# EAGLE design ESP32S3 LoRa Mini Camera Board 120426 (EAGLE 6.5.0)
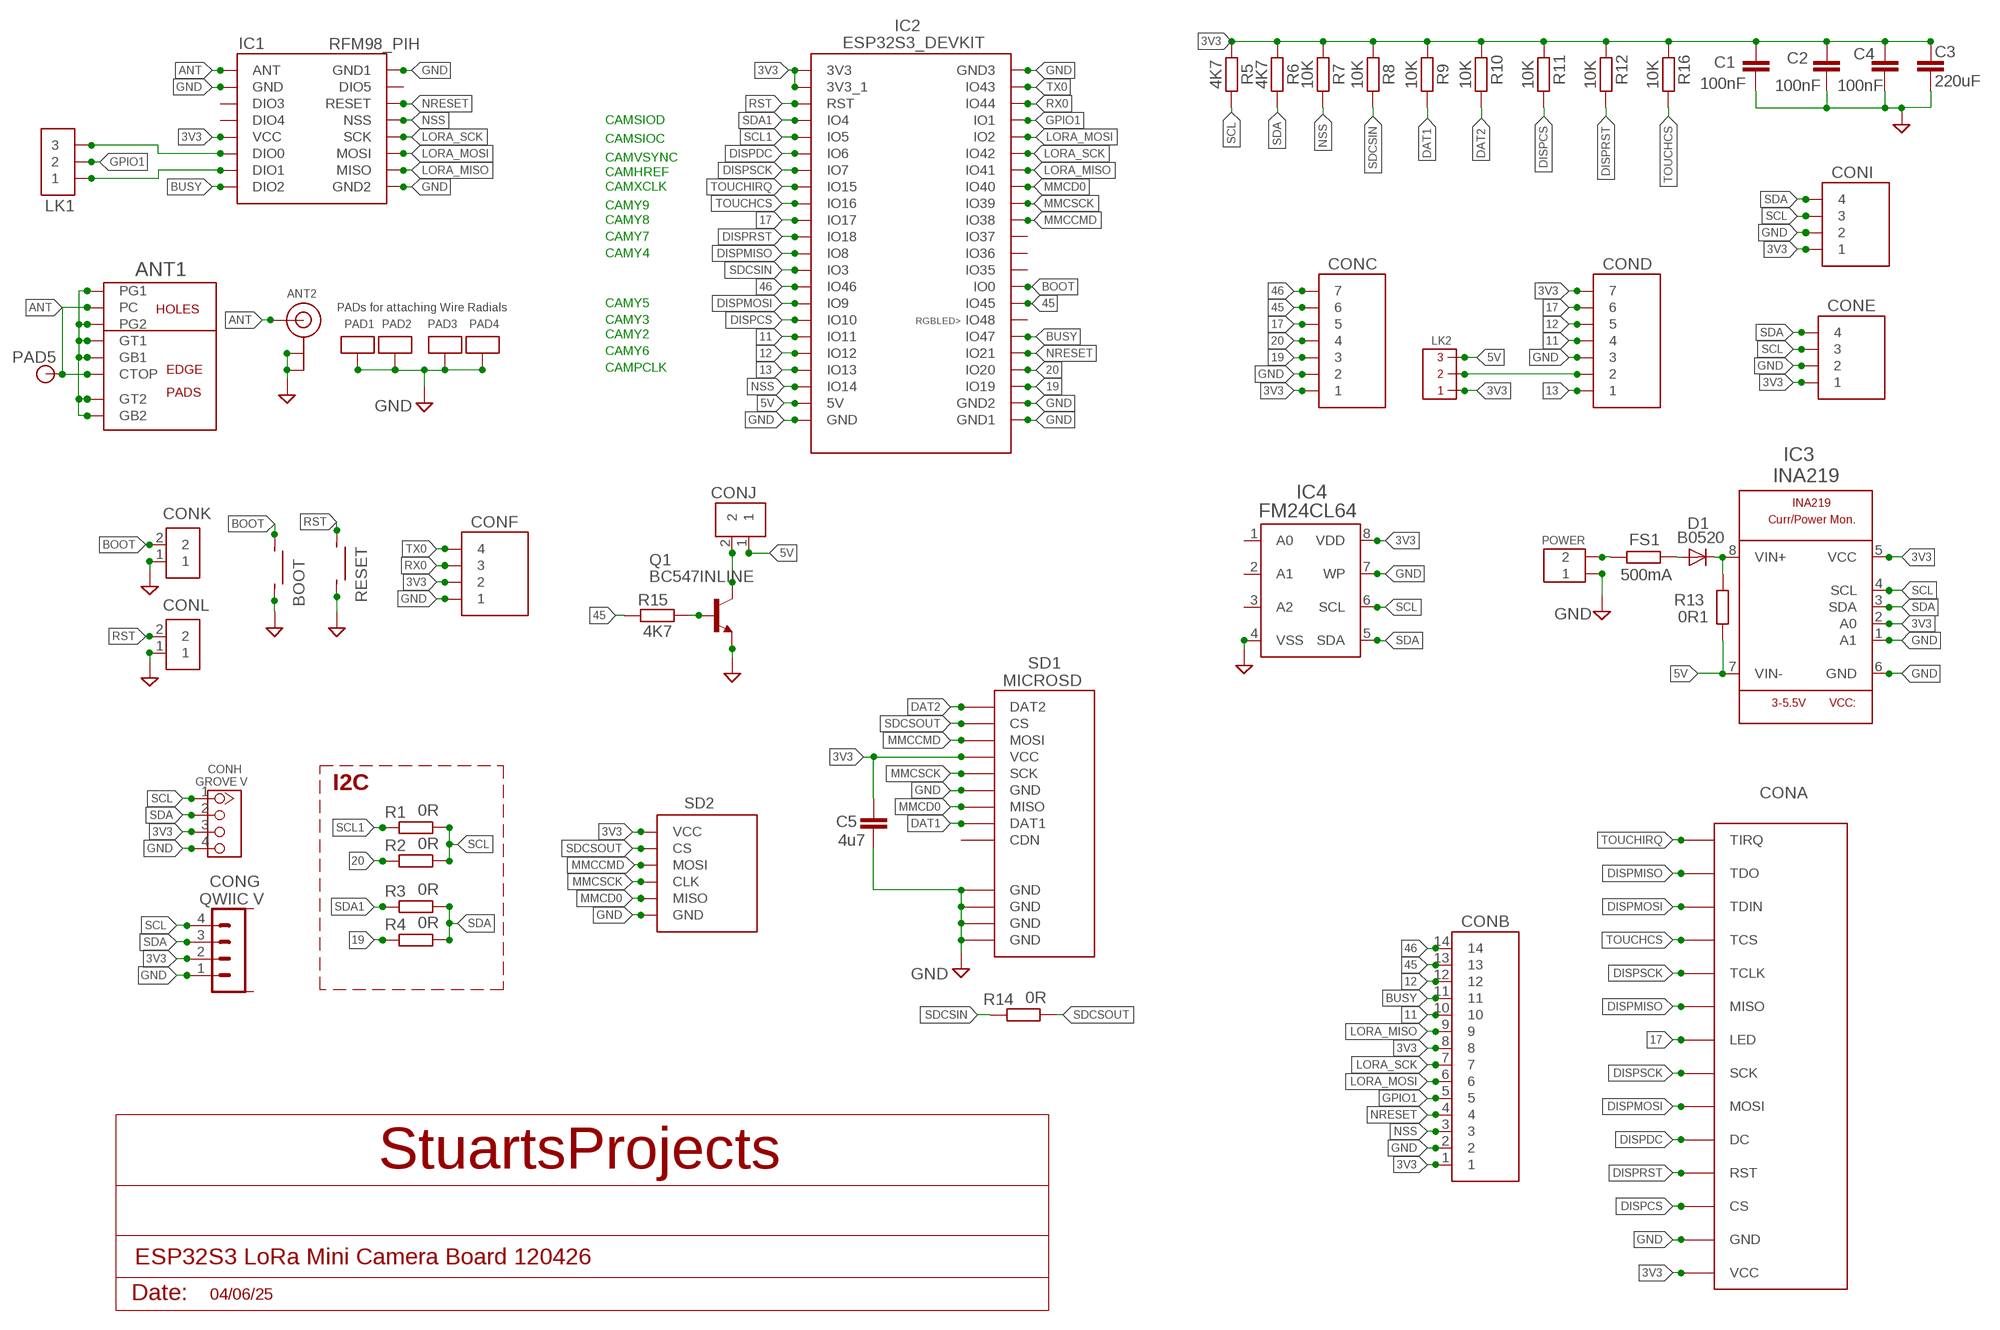
[diagram p0: schematic, sheet 1]

## Parts
ANT1  CUSTOMSMA  [CUSTOMSMA]
ANT2  ANTENNA_U.FL  [U.FL]
BOOT  SMALLSMTSWITCH  [SMALLSMTSWITCH]
C1  100nF  C-EUC1206  [C1206]
C2  100nF  C-EUC1206  [C1206]
C3  220uF  C-EUC1210K  [C1210K]
C4  100nF  C-EUC1206  [C1206]
C5  4u7  C-EUC1206  [C1206]
CONA  ILI9341  ILI9341_2_4_INCH_NOSD_DEFAULT  [ILI9341_2_4_INCH_NOSD]
CONB  14X1  [14X1]
CONC  7X1STD  [7X1]
COND  7X1STD  [7X1]
CONE  4X1  [4X1]
CONF  4X1  [4X1]
CONG  QWIIC V  BM04B-SRSS-TB  [BM04B-SRSS-TB]
CONH  GROVE V  GROVE-CONNECTOR-DIP(4P-2.0)  [HW4-2.0]
CONI  4X1  [4X1]
CONJ  2X1  [2X1]
CONK  2X1  [2X1]
CONL  2X1  [2X1]
D1  B0520  DIODE-SOD123  [SOD123]
FS1  500mA  R-EU_M1206  [M1206]
IC1  RFM98_PIH  [RFM98_PIH]
IC2  ESP32S3_DEVKIT  ESP32S3_DEVKIT_DEFAULT  [ESP32S3_DEVKIT]
IC3  INA219  INA219_SOIC8  [SOIC8]
IC4  FM24CL64  24L256SOIC2  [SOIC_2]
LK1  3X1  [3X1]
LK2  3PINMICROHEADER_ROUND2  [3PINMICROHEADER_SMALL_ROUND_2]
PAD1  ANTPAD2  [ANTPAD2]
PAD2  ANTPAD2  [ANTPAD2]
PAD3  ANTPAD2  [ANTPAD2]
PAD4  ANTPAD2  [ANTPAD2]
PAD5  PAD_ROUND_0_6MM_HOLE  [PAD-ROUND_0_6MM_HOLE]
POWER  SCREWTERMINAL_2WAY_0_1_INCH  [SCREWTERMINAL_2WAY_0_1_INCH]
Q1  BC547INLINE  [TO92-CBE]
R1  0R  R-EU_M1206  [M1206]
R2  0R  R-EU_M1206  [M1206]
R3  0R  R-EU_M1206  [M1206]
R4  0R  R-EU_M1206  [M1206]
R5  4K7  R-EU_M1206  [M1206]
R6  4K7  R-EU_M1206  [M1206]
R7  10K  R-EU_M1206  [M1206]
R8  10K  R-EU_M1206  [M1206]
R9  10K  R-EU_M1206  [M1206]
R10  10K  R-EU_M1206  [M1206]
R11  10K  R-EU_M1206  [M1206]
R12  10K  R-EU_M1206  [M1206]
R13  0R1  R-EU_R1206  [R1206]
R14  0R  R-EU_M1206  [M1206]
R15  4K7  R-EU_M1206  [M1206]
R16  10K  R-EU_M1206  [M1206]
RESET  SMALLSMTSWITCH  [SMALLSMTSWITCH]
SD1  MICROSD  MICROSD_PP  [MICROSD_PP]
SD2  MICROSD_BREAKOUT2_DEFAULT  [MICROSD_BREAKOUT2]

## Nets
3V3 [POWER]: C1.2 C2.2 C3.1 C4.2 C5.1 CONA.VCC CONB.1 CONB.8 CONC.1 COND.7 CONE.1 CONF.2 CONG.2 CONH.3 CONI.1 IC1.VCC IC2.3V3 IC2.3V3_1 IC3.2(A0) IC3.5(VCC) IC4.8(VDD) LK2.1 R5.2 R6.2 R7.2 R8.2 R9.2 R10.2 R11.2 R12.2 R16.2 SD1.VCC SD2.VCC
5V [POWER]: CONJ.1 IC2.5V IC3.7(VIN-) LK2.3 R13.1
11: CONB.10 COND.4 IC2.11(IO11)
12: CONB.12 COND.5 IC2.12(IO12)
13: COND.1 IC2.13(IO13)
17: CONA.LED CONC.5 COND.6 IC2.17(IO17)
19: CONC.3 IC2.19(IO19) R4.2
20: CONC.4 IC2.20(IO20) R2.2
45: CONB.13 CONC.6 IC2.45(IO45) R15.2
46: CONB.14 CONC.7 IC2.46(IO46)
ANT [Antenna]: ANT1.CTOP ANT1.PC ANT2.3(SIGNAL) IC1.ANT PAD5.P$1
BOOT: BOOT.P$4 CONK.2 IC2.0(IO0)
BUSY: CONB.11 IC1.DIO2 IC2.47(IO47)
DAT1: R9.1 SD1.DAT1
DAT2: R10.1 SD1.DAT2
DISPCS: CONA.CS IC2.10(IO10) R11.1
DISPDC: CONA.DC IC2.6(IO6)
DISPMISO: CONA.MISO CONA.TDO IC2.8(IO8)
DISPMOSI: CONA.MOSI CONA.TDIN IC2.9(IO9)
DISPRST: CONA.RST IC2.18(IO18) R12.1
DISPSCK: CONA.SCK CONA.TCLK IC2.7(IO7)
GND [POWER]: ANT1.G1 ANT1.G2 ANT1.GB1 ANT1.GB2 ANT1.GT1 ANT1.GT2 ANT2.1(GND) ANT2.2(GND) BOOT.P$3 C1.1 C2.1 C3.2 C4.1 C5.2 CONA.GND CONB.2 CONC.2 COND.3 CONE.2 CONF.1 CONG.1 CONH.4 CONI.2 CONK.1 CONL.1 IC1.GND IC1.GND1 IC1.GND2 IC2.GND IC2.GND1 IC2.GND2 IC2.GND3 IC3.1(A1) IC3.6(GND) IC4.4(VSS) IC4.7(WP) PAD1.P$1 PAD2.P$1 PAD3.P$1 PAD4.P$1 POWER.P$1 Q1.E RESET.P$3 SD1.GND SD1.GND@1(GND) SD1.GND@2(GND) SD1.GND@3(GND) SD1.GND@4(GND) SD2.GND
GPIO1: CONB.5 IC2.1(IO1) LK1.2
LORA_MISO: CONB.9 IC1.MISO IC2.41(IO41)
LORA_MOSI: CONB.6 IC1.MOSI IC2.2(IO2)
LORA_SCK: CONB.7 IC1.SCK IC2.42(IO42)
MMCCMD: IC2.38(IO38) SD1.MOSI SD2.MOSI
MMCD0: IC2.40(IO40) SD1.MISO SD2.MISO
MMCSCK: IC2.39(IO39) SD1.SCK SD2.SCK(CLK)
N$1 [POWER]: D1.C IC3.8(VIN+) R13.2
N$2: IC1.DIO0 LK1.3
N$3 [POWER]: FS1.1 POWER.P$2
N$4: IC1.DIO1 LK1.1
N$6 [POWER]: D1.A FS1.2
N$7: Q1.B R15.1
N$8 [POWER]: CONJ.2 Q1.C
N$10: COND.2 LK2.2
NRESET: CONB.4 IC1.RESET IC2.21(IO21)
NSS: CONB.3 IC1.NSS IC2.14(IO14) R7.1
RST: CONL.2 IC2.RST RESET.P$4
RX0: CONF.3 IC2.44(IO44)
SCL: CONE.3 CONG.4 CONH.1 CONI.3 IC3.4(SCL) IC4.6(SCL) R1.1 R2.1 R5.1
SCL1: IC2.5(IO5) R1.2
SDA: CONE.4 CONG.3 CONH.2 CONI.4 IC3.3(SDA) IC4.5(SDA) R3.1 R4.1 R6.1
SDA1: IC2.4(IO4) R3.2
SDCSIN: IC2.3(IO3) R8.1 R14.2
SDCSOUT: R14.1 SD1.CS SD2.CS
TOUCHCS: CONA.TCS IC2.16(IO16) R16.1
TOUCHIRQ: CONA.TIRQ IC2.15(IO15)
TX0: CONF.4 IC2.43(IO43)
Unconnected: CONG.M1 CONG.M2 IC1.DIO3 IC1.DIO4 IC1.DIO5 IC2.35(IO35) IC2.36(IO36) IC2.37(IO37) IC2.48(IO48) IC4.1(A0) IC4.2(A1) IC4.3(A2) SD1.CDN

## Notes on the sheet
- CAMSIOD
- CAMSIOC
- CAMVSYNC
- CAMHREF
- CAMXCLK
- CAMY9
- CAMY8
- CAMY7
- CAMY4
- CAMY5
- PADs for attaching Wire Radials
- CAMY3
- CAMY2
- CAMY6
- CAMPCLK
- I2C
- 04/06/25

## Library data of the parts
ANT1 = con-coax:CUSTOMSMA
ANT2 = adafruit:ANTENNA_U.FL: U.FL Antenna Connector
BOOT RESET = LMA2:SMALLSMTSWITCH
C1-C5 = resistor:C-EU: CAPACITOR, European symbol
CONA = LMA2:ILI9341_2_4_INCH_NOSD
CONB = My_Pin_Headers:14X1
CONC COND = My_Pin_Headers:7X1
CONE CONF CONI = My_Pin_Headers:4X1
CONG = con-JST2:BM04B-SRSS: JST SH series header 1.00mm pitch disconnectable crimp style connectors, vertical (side entry type), 4 pins
CONH = OPL_Connector:GROVE-CONNECTOR-DIP(4P-2.0): 320110033; VALUE: 4P-2.0
CONJ CONK CONL = My_Pin_Headers:2X1
D1 = diode:DIODE-: DIODE
FS1 R1-R16 = resistor:R-EU_: RESISTOR, European symbol
IC1 = LMA2:RFM98_PIH
IC2 = LMA2:ESP32S3_DEVKIT
IC3 = INA219:INA219: INA219 - I2C Current/Power Monitor Voltage Range: 0-26V Accuracy: 0.5% Temperature: -40°C - 125°C Check availability <https://pricing.snapeda.com/parts/INA219/Texas%20Instruments/view-part?ref=eda>
IC4 = LMA2:24L256
LK1 = My_Pin_Headers:3X1
LK2 = LMA2:3PINMICROHEADER
PAD1-PAD4 = LMA2:ANTPAD2
PAD5 = pads:PAD_ROUND
POWER = LMA2:SCREWTERMINAL_2WAY_0_1_INCH
Q1 = transistor-npn:BC547*: NPN Transistor
SD1 = DE1594-v2:MICROSD_PP
SD2 = LMA2:MICROSD_BREAKOUT2

## Net classes
0 default: width 0.203 mm, drill 0.406 mm
1 POWER: width 0.635 mm, drill 0.61 mm
2 VDD: width 0.635 mm
3 Antenna: width 0.305 mm

## Board
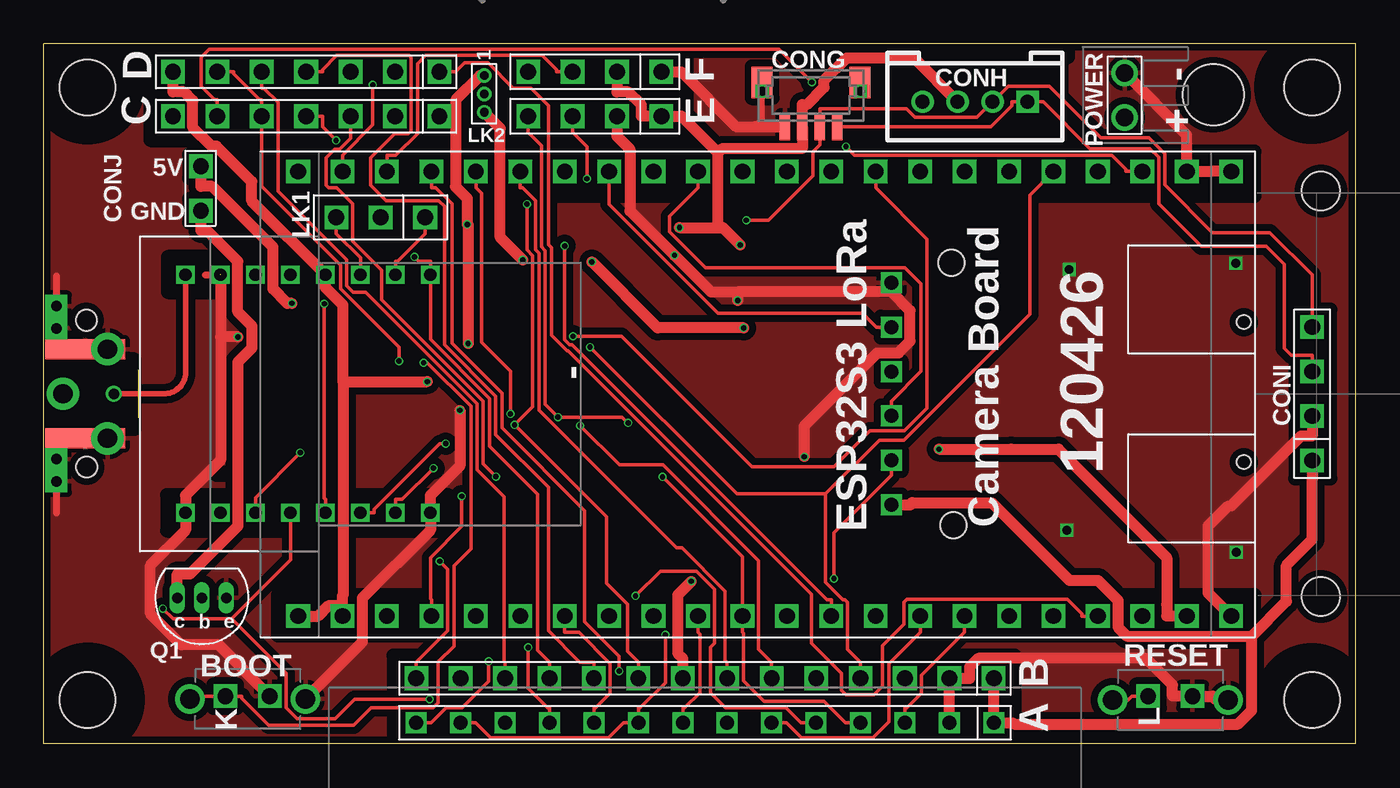
[diagram p1: board, top side]
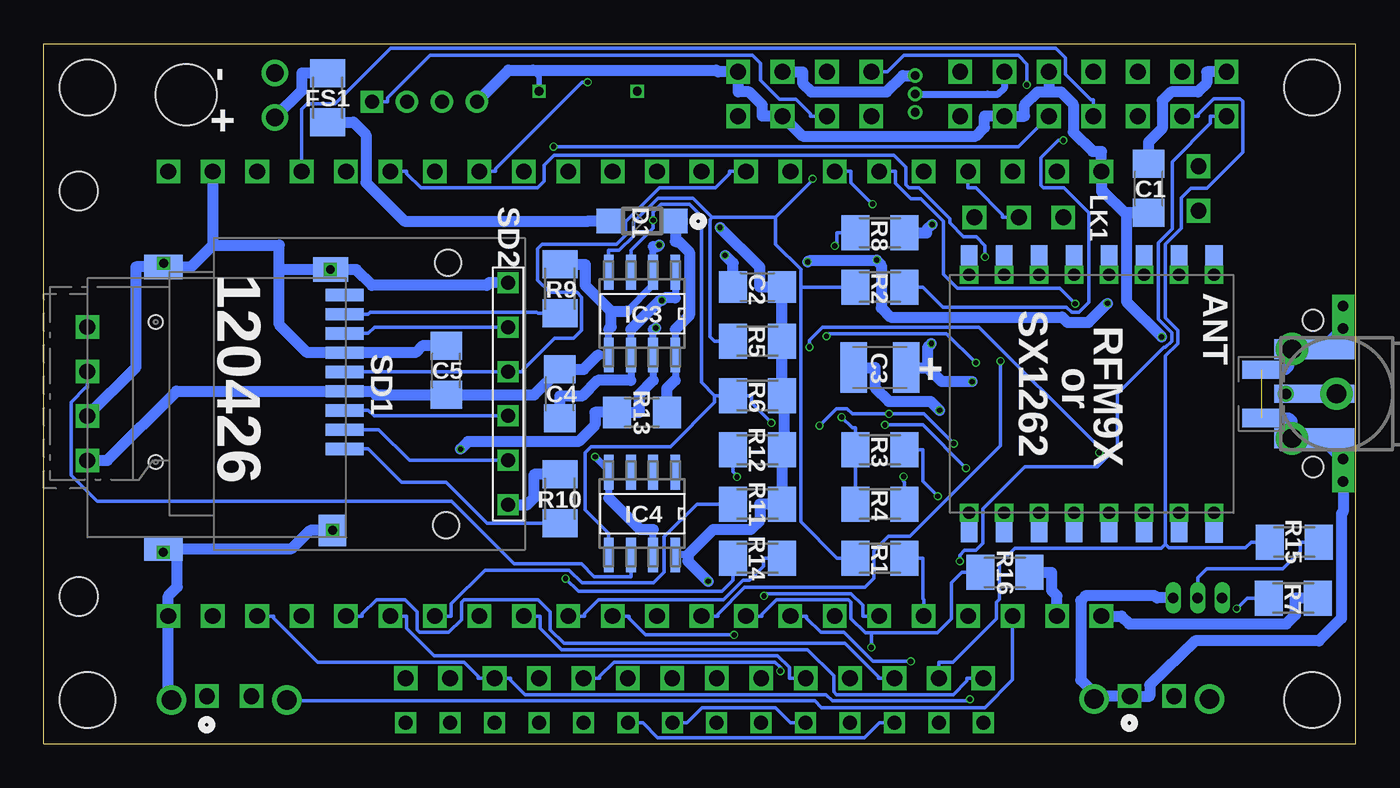
[diagram p2: board, bottom side, seen from below]

Size 75 x 40 mm. Coordinates in mm from the lower left corner, seen from the top.
Outline: 0,0 0,40 75,40 75,0 0,0
Copper layers (1*16): Top 0.035559375mm / dielectric 1.6mm / Bottom 0.035559375mm
Design rules "jlcpcb2layer_Stuarts": minimum track width 5mil, minimum drill 12mil, track to track 6mil, track to pad 6mil, pad to pad 6mil, via to via 6mil, smd to smd 6mil, copper to edge 8mil, drill to drill 6mil, minimum pad ring 5mil, minimum via ring 3mil, stop-mask expansion 2.5mil, vias tented up to drill 1000mil, thermal gap 10mil
Holes 3.2 mm at 2.5,2.5 72.5,2.5 2.5,37.5 72.5,37.5
Holes 1.2 mm at 2.45,15.81 2.44,24.2
Holes 3.5 mm at 66.86,37.08
Holes 2.2 mm at 73,31.58 73,8.42
tRestrict: area 69.8,-0.2 to 75.2,5.2; area -0.2,34.9 to 5.2,40.2; area 69.8,34.9 to 75.1,40.2; area -0.2,-0.1 to 5.2,5.2; area 5.5,37.7 to 6.6,38.2; area 9.9,15.4 to 10.4,15.5; area 12.8,2 to 13,2.1; area 6.1,34.5 to 36.8,39.8; area 20,-0.1 to 55.5,5; area 13.4,6.2 to 69.2,8.5; area 13.4,31.3 to 69.2,33.8; area 71.5,15.2 to 73.5,24.8; 5 more areas
bRestrict: area -0.2,34.9 to 5.1,40.2; area 69.8,34.7 to 75.1,40; area 69.9,-0.1 to 75.2,5.2; area -0.2,-0.1 to 5.1,5.2; area 0,13.9 to 9.5,26.1

### Footprints (pad centres in the part's own frame; a part is rotated, then mirrored left to right if it is on the bottom)
CUSTOMSMA = smd 4.572 x 1.016: CTOP -1.27,0 | drill 1.1 pad 1.85: G1 -2.55,2.55; G2 -2.55,-2.55; PC 0,0 | smd 4.572 x 1.143 bottom: GB1 -1.27,2.54; GB2 -1.27,-2.54 | smd 4.572 x 1.143: GT1 -1.27,2.54; GT2 -1.27,-2.54
U.FL = smd 2.2 x 1.05: 1 0,1.375; 2 0,-1.375 | smd 0.8 x 1: 3 1.525,0
SMALLSMTSWITCH = drill 1.1 pad 1.7: P$3 -3.3,0; P$4 3.3,0
C1206 = smd 1.6 x 1.8: 1 -1.4,0; 2 1.4,0
C1210K = smd 1.5 x 2.9: 1 -1.5,0; 2 1.5,0
ILI9341_2_4_INCH_NOSD = drill 0.8 square: CS -11.43,0; DC -6.35,0; GND -13.97,0; LED 1.27,0; MISO 3.81,0; MOSI -3.81,0; RST -8.89,0; SCK -1.27,0; TCLK 6.35,0; TCS 8.89,0; TDIN 11.43,0; TDO 13.97,0; TIRQ 16.51,0; VCC -16.51,0
14X1 = drill 0.9 square: 1 -16.51,0; 2 -13.97,0; 3 -11.43,0; 4 -8.89,0; 5 -6.35,0; 6 -3.81,0; 7 -1.27,0; 8 1.27,0; 9 3.81,0; 10 6.35,0; 11 8.89,0; 12 11.43,0; 13 13.97,0; 14 16.51,0
7X1 = drill 0.9 square: 1 -7.62,0; 2 -5.08,0; 3 -2.54,0; 4 0,0; 5 2.54,0; 6 5.08,0; 7 7.62,0
4X1 = drill 0.9 square: 1 -3.81,0; 2 -1.27,0; 3 1.27,0; 4 3.81,0
BM04B-SRSS-TB = smd 0.6 x 1.55: 1 1.5,0; 2 0.5,0; 3 -0.5,0; 4 -1.5,0 | smd 1.2 x 1.8: M1 2.8,-2.525; M2 -2.8,-2.525
HW4-2.0 = drill 0.8 pad 1.27 square: 1 -3,0 | drill 0.8 pad 1.27: 2 -1,0; 3 1,0; 4 3,0
2X1 = drill 0.9 square: 1 -1.27,0; 2 1.27,0
SOD123 = smd 1.4 x 1.4: A 1.9,0; C -1.9,0
M1206 = smd 1.6 x 2: 1 -1.4,0; 2 1.4,0
RFM98_PIH = drill 0.7 pad 0.965 square: ANT -6.8,7.5; DIO0 -6.8,-2.5; DIO1 -6.8,-4.5; DIO2 -6.8,-6.5; DIO3 -6.8,3.5; DIO4 -6.8,1.5; DIO5 6.8,5.5; GND -6.8,5.5; GND2 6.8,-6.5; MISO 6.8,-4.5; MOSI 6.8,-2.5; NSS 6.8,1.5; RESET 6.8,3.5; SCK 6.8,-0.5; VCC -6.8,-0.5 | drill 0.7 pad 1.016 square: GND1 6.8,7.5 | smd 2.2 x 1: P$2 -7.4,7.5; P$6 7.4,7.5 | smd 2.159 x 0.965: P$4 -7.4,5.5; P$5 -7.4,1.5; P$7 7.4,5.5; P$9 -7.4,3.5; P$10 -7.4,-0.5; P$11 -7.4,-2.5; P$12 -7.4,-4.5; P$13 -7.4,-6.5; P$14 7.4,-6.5; P$15 7.4,-4.5; P$16 7.4,-2.5; P$17 7.4,-0.5; P$18 7.4,1.5; P$19 7.4,3.5
ESP32S3_DEVKIT = drill 0.9 square: 0 12.7,-35.56; 1 12.7,-10.16; 2 12.7,-12.7; 3 -12.7,-33.02; 3V3 -12.7,-2.54; 3V3_1 -12.7,-5.08; 4 -12.7,-10.16; 5 -12.7,-12.7; 5V -12.7,-53.34; 6 -12.7,-15.24; 7 -12.7,-17.78; 8 -12.7,-30.48; 9 -12.7,-38.1; 10 -12.7,-40.64; 11 -12.7,-43.18; 12 -12.7,-45.72; 13 -12.7,-48.26; 14 -12.7,-50.8; 15 -12.7,-20.32; 16 -12.7,-22.86; 17 -12.7,-25.4; 18 -12.7,-27.94; 19 12.7,-50.8; 20 12.7,-48.26; 21 12.7,-45.72; 35 12.7,-33.02; 36 12.7,-30.48; 37 12.7,-27.94; 38 12.7,-25.4; 39 12.7,-22.86; 40 12.7,-20.32; 41 12.7,-17.78; 42 12.7,-15.24; 43 12.7,-5.08; 44 12.7,-7.62; 45 12.7,-38.1; 46 -12.7,-35.56; 47 12.7,-43.18; 48 12.7,-40.64; GND -12.7,-55.88; GND1 12.7,-55.88; GND2 12.7,-53.34; GND3 12.7,-2.54; RST -12.7,-7.62
SOIC8 = smd 1.981 x 0.559: 1 -2.362,1.905; 2 -2.362,0.635; 3 -2.362,-0.635; 4 -2.362,-1.905; 5 2.362,-1.905; 6 2.362,-0.635; 7 2.362,0.635; 8 2.362,1.905
SOIC_2 = smd 1.981 x 0.559: 1 -2.362,1.905; 2 -2.362,0.635; 3 -2.362,-0.635; 4 -2.362,-1.905; 5 2.362,-1.905; 6 2.362,-0.635; 7 2.362,0.635; 8 2.362,1.905
3X1 = drill 0.9 square: 1 -2.54,0; 2 0,0; 3 2.54,0
3PINMICROHEADER_SMALL_ROUND_2 = drill 0.5 pad 0.813: 1 0,-1.05; 2 0,0.001; 3 0,1.05
ANTPAD2 = drill 0.6 pad 1.27 square: P$1 0,0
PAD-ROUND_0_6MM_HOLE = drill 0.6: P$1 0,0
SCREWTERMINAL_2WAY_0_1_INCH = drill 1: P$1 -1.27,0; P$2 1.27,0
TO92-CBE = drill 0.6 long: B 0,0; C 1.4,0; E -1.4,0
R1206 = smd 1.6 x 1.803: 1 -1.422,0; 2 1.422,0
MICROSD_PP = smd 2.2 x 0.7: CDN -0.2,-4.95; CS -0.2,2.75; DAT1 -0.2,-3.85; DAT2 -0.2,3.85; GND -0.2,-1.65; MISO -0.2,-2.75; MOSI -0.2,1.65; SCK -0.2,-0.55; VCC -0.2,0.55 | smd 1.6 x 1.8: GND@1 0.5,8.5 | smd 2.2 x 1.4: GND@2 10.15,9.55; GND@4 10.15,-6.55 | smd 2 x 1.4: GND@3 0.6,-6.4 | hole 0.8: 10.6,4.6; 10.6,-3.4
MICROSD_BREAKOUT2 = drill 0.8 square: CS 3.81,0; GND -6.35,0; MISO -3.81,0; MOSI 1.27,0; SCK -1.27,0; VCC 6.35,0 | hole 1.5: -7.5,-3.44; 7.5,-3.54

### Placement (x,y rotation side)
ANT1  1.1,20 0 bottom
ANT2  5.4,20 0 bottom
BOOT  11.66,2.56 180 top
C1  11.83,31.73 90 bottom
C2  34.2,26.1 0 bottom
C3  27.2,21.5 180 bottom
C4  45.5,20 90 bottom
C5  52,21.33 90 bottom
CONA  37.8,1.2 180 top
CONB  37.8,3.74 180 top
CONC  15,35.86 180 top
COND  15,38.4 180 top
CONE  31.5,35.86 180 top
CONF  31.5,38.4 180 top
CONG  43.87,35.27 180 top
CONH  53.24,36.69 180 top
CONI  72.51,20 90 top
CONJ  8.98,31.73 270 top
CONK  11.65,2.72 180 top
CONL  64.4,2.72 180 top
D1  40.8,29.87 180 bottom
FS1  58.77,36.92 270 bottom
IC1  15.6,20 270 bottom
IC2  12,20 90 top
IC3  40.8,24.58 270 bottom
IC4  40.8,13.15 270 bottom
LK1  19.26,30.08 180 top
LK2  25.18,37.13 180 top
PAD1  0.72,23.74 0 top
PAD2  0.72,25.01 0 top
PAD3  0.72,15 0 top
PAD4  0.72,16.26 0 top
PAD5  4,20 0 top
POWER  61.79,37.06 270 top
Q1  9.04,8.34 180 top
R1  27.2,10.6 0 bottom
R2  27.2,26.1 0 bottom
R3  27.2,16.8 0 bottom
R4  27.2,13.7 0 bottom
R5  34.2,23 0 bottom
R6  34.2,19.9 0 bottom
R7  3.58,8.32 0 bottom
R8  27.2,29.2 0 bottom
R9  45.5,26 90 bottom
R10  45.5,14 90 bottom
R11  34.2,13.7 0 bottom
R12  34.2,16.8 0 bottom
R13  40.8,18.93 0 bottom
R14  34.2,10.6 0 bottom
R15  3.52,11.52 180 bottom
R16  20.05,9.79 0 bottom
RESET  64.4,2.5 180 top
SD1  58,20.7 180 bottom
SD2  48.45,20 270 bottom

### Tracks (layer width: path | path; a pad name or v marks a point on that pad's centre or on a via)
3V3  (via drill 0.3 pad 0.46)
  Top 0.635: 38.55,33.77 38.8,34.02 43.37,34.02 CONG.2 43.37,36.52 43.62,36.52 44.61,37.51 44.61,37.9 45.9,39.2 49.73,39.2 CONH.3 | 38.55,33.77 36.45,35.86 CONE.1 34.16,35.86 34.16,36.5 33.41,37.26 32.77,37.26 CONF.2 | 38.55,29.5 38.55,33.77 | 38.55,29.5 38.81,29.5 v39.81,28.5 | v36.34,29.5 38.55,29.5 | 69.05,6.16 61.91,6.16 61.41,6.66 61.41,8.19 61.4,8.19 60.26,9.33 58.63,9.33 54.2,13.76 49.68,13.76 49.65,13.78 49.52,13.65 SD2.VCC | 17.11,20.69 v21.93,20.69 | 17.11,20.69 17.11,25.06 16.1,26.07 IC1.VCC 11.89,31.01 11.89,32.12 9.86,34.15 9.59,34.15 8.53,35.21 8.53,36.75 8.02,37.26 7.38,37.26 COND.7 | CONI.1 72.51,15.04 72.51,11.68 71.03,10.2 71.03,8.13 69.05,6.16 | 17.11,20.69 17.11,8.47 17.08,8.45 17.08,7.87 | v24.26,22.87 24.26,29.63 v24.21,29.68 24.21,31.16 23.54,31.84 23.54,35.86 | 23.54,35.86 23.55,35.86 23.55,36.79 24.94,38.18 LK2.1 | CONC.1 23.54,35.86 | IC2.3V3 15.69,7.3 16.26,7.87 17.08,7.87 | IC2.3V3_1 17.08,7.87 | CONB.8 36.53,4.88 36.23,5.18 36.23,8.5 v37.02,9.28 | 69.05,6.16 69.05,1.91 68.26,1.12 55.46,1.12 55.38,1.2 CONA.VCC CONB.1
  Bottom 0.406: 40.16,28.4 IC3.2 40.16,26.22 41.66,24.72 | 42.7,23.68 IC3.5 43.31,22.22 | 38.17,10.79 IC4.8
  Bottom 0.635: R10.2 46.97,15.4 46.97,14.06 47.38,13.65 SD2.VCC | v36.34,29.5 34.07,27.23 34.07,26.1 C2.2 R5.2 R6.2 32.7,19.8 32.7,16.9 R12.2 R11.2 34.07,13.7 34.07,12.75 34.59,12.23 36.73,12.23 38.17,10.79 38.17,10.44 v37.02,9.28 | 40.16,28.4 39.91,28.4 v39.81,28.5 | 42.57,24.72 41.66,24.72 | v21.93,20.69 23.67,20.69 24.48,21.5 | R7.2 3.45,8.32 3.45,7.37 3.97,6.85 12.95,6.85 13.39,7.3 IC2.3V3 | 42.57,24.72 44.03,26.18 44.03,27.4 R9.2 | 42.7,23.68 42.57,23.82 42.57,24.72 | 43.31,22.22 44.13,21.4 C4.2 46.97,19.93 C5.1 56.01,19.93 56.23,20.15 SD1.VCC 67.41,20.15 71.36,16.19 CONI.1 | C3.1 24.48,21.5 | v24.26,22.87 24.48,22.65 24.48,21.5 | R8.2 24.53,29.2 24.53,29.36 v24.21,29.68 | C1.2 11.83,34.4 11.06,35.16 11.06,36.74 10.55,37.26 9.03,37.26 8.53,37.76 8.53,38.4 COND.7 | CONF.2 31.62,38.4 31.62,37.76 31.12,37.26 26.82,37.26 25.89,38.18 LK2.1 | R16.2 17.38,9.79 17.38,8.74 17.08,8.45 IC2.3V3_1
5V  (via drill 0.3 pad 0.46)
  Top 0.635: IC2.5V 64.19,7.3 64.19,7.94 64.19,10.63 58,16.83 55.31,16.83 v51.17,16.83 | v40.01,23.77 35.1,23.77 v31.33,27.53 | v27.38,27.65 26.09,28.94 26.09,35.16 LK2.3 | CONJ.1 8.98,31.86 9.62,31.86 13.11,28.37 13.11,25.99 13.92,25.17 v14.19,25.17
  Bottom 0.406: 40.16,23.68 IC3.7 40.16,20.76
  Bottom 0.635: v51.17,16.83 50.74,17.26 44.44,17.26 43.49,18.2 43.49,18.93 R13.1 42.12,18.93 40.95,18.93 40.95,19.97 40.16,20.76 | 27.38,27.59 31.27,27.59 v31.33,27.53 | 27.38,27.59 27.12,27.34 27.12,24.91 26.6,24.38 16.77,24.38 16.48,24.08 15.28,24.08 v14.19,25.17 | 27.38,27.59 v27.38,27.65 | 40.16,23.68 40.09,23.68 v40.01,23.77
11
  Top 0.203: COND.4 15.93,38.4 15.93,38.52 16.74,39.33 20.88,39.33 21.01,39.2 21.01,35.01 20.84,34.85 20.05,34.85 18.69,33.49 18.69,31.92 19.58,31.03 22.57,31.03 22.9,30.7 22.9,22.81 25.84,19.87 25.84,17.66 28.85,14.64 28.85,6.46 30.64,4.67 31.45,4.67 CONB.10
  Bottom 0.203: CONB.10 32.38,3.74 32.38,4.36 33.04,5.03 52.67,5.03 54.25,6.6 54.25,7.3 IC2.11
12
  Top 0.203: CONB.12 26.37,4.67 26.31,4.73 26.31,14.12 24.77,15.66 24.77,19.43 18.4,25.8 17.68,25.8 17.32,26.16 17.32,27.65 13.39,31.58 13.39,36.66 12.58,37.47 12.46,37.47 COND.5
  Bottom 0.203: CONB.12 27.3,3.74 27.3,3.84 29.2,5.74 45.26,5.74 46.05,6.52 46.05,7.55 46.73,8.23 50.98,8.23 51.13,8.08 51.13,7.09 51.85,6.37 53.52,6.37 53.67,6.52 53.67,7.55 54.35,8.23 55.98,8.23 56.79,7.42 56.79,7.3 IC2.12
13
  Top 0.203: COND.1 23.55,38.4 24.05,38.9 25.39,38.9 26.82,37.47 27.85,37.47 28.85,36.47 28.85,28.5 29.02,28.33 29.02,23.34 29.91,22.45 29.97,22.45 43.88,8.54 43.88,5.74 45.59,4.02 45.59,3.06 45.86,2.79 47.47,2.79 47.95,3.27 47.95,5.6 49.17,6.82 49.17,8.09 49.33,8.24 58.5,8.24 59.33,7.42 59.33,7.3 IC2.13
17  (via drill 0.3 pad 0.46)
  Top 0.203: v20.31,21.87 20.31,22.67 16.96,26.01 16.96,27.35 12.46,31.85 CONC.5 12.46,36.79 12.34,36.79 10.85,38.28 10.85,38.4 COND.6 | CONA.LED 36.53,2.05 36.64,2.05 37.5,2.92 37.5,6.27 37.4,6.37 IC2.17
  Bottom 0.203: v20.31,21.87 20.31,17.03 25.49,11.85 26.72,11.85 27.55,11.03 27.55,9.45 28.06,8.94 34.93,8.94 36.47,7.4 36.47,7.3 IC2.17
19  (via drill 0.3 pad 0.46)
  Top 0.203: v25.85,15.27 25.13,15.99 25.13,19.57 19.32,25.38 19.32,27.05 17.65,28.72 17.65,30.87 16.75,31.77 16.3,31.77 16.15,31.92 16.15,33.48 16.64,33.97 16.91,33.97 17.54,34.59 CONC.3 | v45.86,34.12 46.35,33.63 61.06,33.63 61.87,32.82 61.87,32.7 IC2.19
  Bottom 0.203: CONC.3 19.28,34.12 v45.86,34.12 | R4.2 25.8,14.95 25.85,15.01 v25.85,15.27
20  (via drill 0.3 pad 0.46)
  Top 0.203: v16.72,34.48 15.93,35.27 15.93,35.86 CONC.4
  Bottom 0.203: v16.72,34.48 17.01,34.48 18.01,33.48 18.01,31.92 17.86,31.77 16.69,31.77 15.27,30.35 15.27,25.23 15.84,24.66 16.24,24.66 16.54,24.95 | 16.54,24.95 | 16.54,24.95 23.6,24.95 24.75,26.1 R2.2 | CONC.4 15,36.79 15.15,36.79 16.61,38.25 16.61,39.2 17.15,39.74 55.17,39.74 58.33,36.57 59.94,36.57 60.26,36.26 IC2.20
45  (via drill 0.3 pad 0.46)
  Top 0.203: CONC.6 9.92,36.79 9.77,36.79 8.99,37.57 8.99,39.22 9.46,39.69 42.02,39.69 v43.91,37.8
  Bottom 0.203: 10.88,22.16 10.17,22.87 10.17,23.64 10.88,24.34 10.88,28.54 9.96,29.46 9.96,31.19 9.42,31.73 8.52,31.73 6.45,33.8 6.45,36.7 6.62,36.87 8.1,36.87 8.99,35.98 8.99,35.86 CONC.6 | 10.88,22.16 | 10.88,22.16 10.88,11.39 | v43.91,37.8 44.23,37.8 49.17,32.85 49.17,32.7 IC2.45 | 10.88,11.39 10.68,11.19 6.31,11.19 5.97,11.52 R15.2 | 10.88,11.39 11.11,11.16 19.48,11.16 20.37,10.26 20.37,8.26 20.55,8.08 20.55,7.14 23.02,4.67 23.83,4.67 CONB.13
46  (via drill 0.3 pad 0.46)
  Top 0.203: CONB.14 21.29,4.67 23.09,6.47 23.09,9.97 v22.64,10.43
  Bottom 0.203: CONB.14 22.22,3.74 22.22,3.6 23.01,2.81 29.69,2.81 29.84,2.96 29.84,3.87 31.35,5.38 45.41,5.38 46.63,6.6 46.63,7.3 IC2.46 | CONC.7 8.31,35.86 8.31,35.45 10.49,33.27 10.49,29.43 11.3,28.63 11.3,24.26 10.53,23.49 10.53,23.01 10.88,22.66 10.97,22.66 13.62,20.01 13.62,16.97 14.77,15.82 18.93,15.82 21.32,13.43 21.32,11.44 21.72,11.04 22.37,11.04 22.64,10.78 v22.64,10.43
ANT
  Top 0.305: IC1.ANT 8.11,21.2 arc-90 6.87,20 6.03,20 PAD5.P$1
  Bottom 0.305: PAD5.P$1 ANT2.3 ANT1.CTOP ANT1.PC
BOOT  (via drill 0.3 pad 0.46)
  Top 0.203: v21.72,21.77 21.93,21.77 24.42,19.28 24.42,11.14 23.45,10.17 23.45,5.58 22.54,4.67 22.54,2.35 22.25,2.06 18.73,2.06 17.72,1.06 12.86,1.06 11.31,2.6 11.31,2.72 CONK.2 8.52,2.72 BOOT.P$4 | IC2.0 47.56,31.77 50.49,28.84 50.49,19.18 49.19,17.88 47.21,17.88 45.17,15.83 40.5,15.83 33.04,23.29 v30.26,23.29
  Bottom 0.203: v30.26,23.29 30.11,23.44 23.39,23.44 v21.72,21.77
BUSY  (via drill 0.3 pad 0.46)
  Top 0.203: v21.19,27.82 21.42,27.58 22.1,27.58 IC1.DIO2 22.1,23.11 25.48,19.72 25.48,17.01 28.24,14.25 28.24,5.34 28.91,4.67 CONB.11
  Bottom 0.203: IC2.47 54.25,32.7 54.25,32.58 53.44,31.77 46.78,31.77 46.41,32.14 46.41,33.06 45.84,33.63 26.4,33.63 25.71,32.94 25.71,31.94 25.54,31.77 24.98,31.77 23.21,30 23.21,29.76 22.42,28.97 21.69,28.97 21.19,28.47 v21.19,27.82
DAT1
  Bottom 0.203: R9.1 46.75,24.6 46.82,24.66 56.33,24.66 56.45,24.55 SD1.DAT1
DAT2
  Bottom 0.203: SD1.DAT2 56.45,16.85 54.55,14.95 52,14.95 49.65,12.6 R10.1
DISPCS
  Top 0.203: IC2.10 52.64,6.37 50.17,3.9 50.17,2.89 49.34,2.05 49.23,2.05 CONA.CS
  Bottom 0.203: R11.1 37.65,13.7 39.53,11.81 39.53,9.79 40.13,9.19 44.24,9.19 44.98,9.93 49.78,9.93 51.71,8 51.71,7.3 IC2.10
DISPDC  (via drill 0.3 pad 0.46)
  Top 0.203: CONA.DC 43.3,1.2 42.44,2.05 38.97,2.05 38.1,2.92 38.1,5.5 38.33,5.73 38.33,8.84 37.31,9.86 35.24,9.86 v33.83,8.44
  Bottom 0.203: IC2.6 28.17,7.3 28.17,7.91 28.84,8.59 33.69,8.59 v33.83,8.44
DISPMISO  (via drill 0.3 pad 0.46)
  Top 0.203: v35.53,6.22 35.53,3.49 34.1,2.05 33.99,2.05 CONA.MISO 33.14,1.2 32.28,0.35 25.54,0.35 24.68,1.2 CONA.TDO
  Bottom 0.203: v35.53,6.22 40.59,6.22 41.55,7.18 41.55,7.3 IC2.8
DISPMOSI
  Top 0.203: CONA.MOSI 42.46,1.2 43.32,0.35 47.4,0.35 48.3,1.25 48.3,4.57 50.1,6.37 IC2.9
  Bottom 0.203: CONA.TDIN 27.22,1.2 28.08,0.35 39.9,0.35 40.76,1.2 CONA.MOSI
DISPRST  (via drill 0.3 pad 0.46)
  Top 0.203: v35.37,15.25 39.94,10.68 IC2.18 39.94,6.37 40,6.31 40,3.61 41.17,2.44 44.6,2.44 45.84,1.2 CONA.RST
  Bottom 0.203: R12.1 35.6,15.55 35.37,15.32 v35.37,15.25
DISPSCK
  Top 0.203: CONA.TCLK 31.45,2.05 31.56,2.05 32.38,2.88 32.38,4.58 30.59,6.37 29.78,6.37 IC2.7
  Bottom 0.203: CONA.SCK 38.22,1.2 37.36,2.05 33.16,2.05 32.3,1.2 CONA.TCLK
GND  (via drill 0.3 pad 0.46, 0.5 pad 0.46)  (2 unrouted)
  Top 0.305: v41.07,37.28 41.07,35.67 40.67,35.27
  Top 0.406: 0.74,25 0.74,26.72 | 9.23,26.8 IC1.GND | 0.74,13.19 0.74,14.91
  Top 0.635: 39.66,25.82 38.15,25.82 v36.05,27.91 33.51,30.46 33.51,33.98 32.77,34.72 CONE.2 | 48.45,25.82 39.66,25.82 | 39.66,25.82 v39.66,25.33 | CONK.1 9.99,5.65 7.87,5.65 6.09,7.43 6.09,10.19 8.1,12.21 IC1.GND1 8.1,14.2 10.1,16.2 10.1,23.25 | v23.79,19.06 23.79,15.88 22.1,14.2 IC1.GND2 22.1,12.21 18.23,8.33 18.23,5.83 BOOT.P$3 | IC1.GND 10.1,23.25 | v11.1,23.25 10.1,23.25 | IC2.GND1 66.73,32.7 IC2.GND2 65.34,34.78 POWER.P$1 | CONF.1 36.45,38.4 39.59,35.27 40.67,35.27 CONG.1 | CONI.2 72.51,17.59 71.87,17.59 67.88,13.6 67.72,13.6 66.57,12.45 66.57,8.61 IC2.GND | v43.48,16.4 43.48,18.16 47.66,22.34 48.86,22.34 49.52,23 49.52,24.75 48.45,25.82 | SD2.GND 48.45,25.82 | ANT1.GT1 2.53,22.38 3.48,22.38 ANT1.G1 | ANT1.G2 2.53,17.46 ANT1.GT2 | RESET.P$3 67.03,2.5 66.81,2.72 CONL.1 64.53,2.72 64.53,3.36 63,4.88 53.42,4.88 52.91,4.38 52.91,3.74 CONB.2 CONA.GND | PAD1.P$1 0.72,24.84 0.71,24.85 PAD2.P$1
  Bottom 0.305: v58.62,27.1 SD1.GND@3 | v68.14,27.46 SD1.GND@4 | v46.69,37.28 46.69,38.15 47.04,38.5
  Bottom 0.406: IC4.7 40.16,12.25 | 42.7,14.05 IC4.4 42.7,15.63 v43.48,16.4 | IC3.1 38.9,25.48 | 41.44,20.76 IC3.6 41.44,23.68
  Bottom 0.635: C2.1 35.6,27.47 35.61,27.47 v36.05,27.91 | 41.44,23.68 39.78,25.33 v39.66,25.33 39.51,25.48 38.9,25.48 | 13.11,30.33 13.11,25.26 v11.1,23.25 | 13.11,30.33 13.1,30.33 12.95,30.33 C1.1 | 13.11,30.33 13.15,30.33 13.2,30.33 14.43,31.55 14.54,31.55 IC2.GND3 14.54,33.11 14.54,33.84 15.04,33.84 16.14,34.95 16.14,36.55 16.85,37.26 17.54,37.26 | 65.34,28.49 66.58,27.25 SD1.GND@4 69.72,27.25 69.72,21.52 CONI.2 | 65.34,28.49 65.34,31.75 IC2.GND2 | 65.34,28.49 61.53,28.49 61.53,27.15 | SD1.GND@3 57.13,27.1 56.23,26.2 49.67,26.2 49.52,26.35 SD2.GND | 42.7,14.05 40.9,12.25 40.16,12.25 | Q1.E 11.36,8.34 11.46,8.45 15.46,8.45 15.72,8.19 15.72,3.64 14.8,2.72 | 14.8,2.72 BOOT.P$3 | 14.8,2.72 CONK.1 11.78,2.72 11.78,3.36 9.18,5.88 2.11,5.88 0.82,7.17 0.82,13.15 0.72,13.25 PAD3.P$1 PAD4.P$1 0.8,16.3 1.8,17.3 2.1,17.3 ANT1.GT2 ANT1.G2 3.65,18.45 3.83,18.62 ANT2.2 | 67.36,11.15 67.36,8.96 67.88,8.45 IC2.GND 67.88,2.68 RESET.P$3 | SD1.GND@1 59.77,12.2 60.82,11.15 67.36,11.15 | SD1.GND@2 67.36,11.15 | C5.2 53.37,22.73 53.75,22.35 SD1.GND 59.37,22.35 59.93,22.35 61.53,23.95 61.53,27.15 | C4.1 45.5,19.87 44.23,19.87 43.34,20.76 41.44,20.76 | C3.2 27.48,21.5 27.48,20.36 26.69,19.57 24.3,19.57 v23.79,19.06 | COND.3 17.54,37.26 | 17.54,37.26 18.18,37.26 18.93,36.5 18.93,35.86 CONC.2 21.23,35.86 21.23,35.22 21.73,34.72 31.62,34.72 CONE.2 33.91,35.86 33.91,36.5 34.67,37.26 35.31,37.26 CONF.1 36.45,38.4 36.55,38.5 47.04,38.5 48.43,38.5 CONH.4 | PAD1.P$1 0.8,23.7 1.8,22.7 2.1,22.7 ANT1.GT1 ANT1.G1 | ANT1.G1 3.64,22.47 3.83,22.28 3.83,21.56 4.02,21.38 ANT2.1 | ANT1.G1 | ANT1.G1 | ANT1.G1
  Bottom 0.635: v58.62,27.1 61.48,27.1 61.53,27.15
  other vias: 68.17,10.94 58.49,12.2
  pour Top (isolate 0.4): 0,40 75,40 75,0 0,0
GPIO1  (via drill 0.3 pad 0.46)
  Top 0.203: v32.9,4.15 32.9,5 30.92,6.98 30.92,13.33 26.2,18.06 26.2,20.02 23.34,22.87 23.34,30.84 22.41,31.77 22.16,31.77 IC2.1
  Bottom 0.203: IC2.1 22.16,31.77 21.72,31.77 20.19,30.24 20.19,30.08 LK1.2 | CONB.5 43.22,3.74 43.22,3.86 42.41,4.67 33.19,4.67 32.9,4.38 v32.9,4.15
LORA_MISO  (via drill 0.3 pad 0.46)
  Top 0.203: v27.62,30.84 27.62,28.22 27.95,27.89 27.95,19.26 v26.92,18.22 32.16,12.98 32.16,9.18 33.38,7.96 33.38,5.28 33.99,4.67 CONB.9 | v22.27,15.76 20.5,13.98 20.1,13.98 IC1.MISO
  Bottom 0.203: v26.92,18.22 24.74,18.22 v22.27,15.76 | IC2.41 28.85,32.7 28.85,32.07 v27.62,30.84
LORA_MOSI  (via drill 0.3 pad 0.46)
  Top 0.203: CONB.6 41.61,4.67 40.87,5.41 40.87,10.46 35.4,15.93 32.91,15.93 v30.66,18.18 | IC1.MOSI 18.88,13.2 18.88,13.39 22.63,17.15 v22.98,17.15 | IC2.2 24.7,31.77 25.02,31.45 25.02,22.93 26.68,21.28 v26.68,18.85
  Bottom 0.203: v30.66,18.18 29.68,19.15 29.09,19.15 28.78,18.85 v26.68,18.85 24.68,18.85 v22.98,17.15
LORA_SCK  (via drill 0.3 pad 0.46)
  Top 0.203: IC1.SCK 16.1,13.98 16.04,14.04 v16.04,25.14 | IC2.42 27.24,31.77 27.38,31.77 28.11,31.04 28.11,28.24 28.31,28.03 28.31,19.07 36.18,11.19 36.48,11.19 38.95,8.72 38.95,4.79 39.07,4.67 CONB.7
  Bottom 0.203: v16.04,25.14 16.92,26.02 22.77,26.02 23.57,26.82 23.57,29.85 24.87,31.16 25.43,31.16 26.31,32.03 26.31,32.7 IC2.42
MMCCMD
  Top 0.203: IC2.38 37.4,31.77 35.77,30.14 35.77,29.26 37.83,27.2 49.23,27.2 50.14,26.3 50.14,21.27 48.45,19.58 SD2.MOSI
  Bottom 0.203: SD1.MOSI 56.45,19.05 56.13,18.73 SD2.MOSI
MMCD0
  Top 0.203: IC2.40 32.32,30.84 38.56,24.6 46.8,24.6 47.6,23.81 SD2.MISO
  Bottom 0.203: SD1.MISO 56.45,23.45 56.09,23.81 SD2.MISO
MMCSCK
  Bottom 0.203: SD1.SCK 56.45,21.25 56.43,21.27 SD2.SCK 48.02,21.27 47.6,21.27 47.6,21.38 45.8,23.17 44.7,23.17 44.25,23.63 44.25,25.52 44.51,25.79 46.06,25.79 46.76,26.49 46.76,28.3 46.52,28.54 42.26,28.54 41.75,29.06 41.75,29.84 39.81,31.77 36.6,31.77 35.79,32.58 35.79,32.7 IC2.39
N$1
  Bottom 0.406: 38.9,20.76 IC3.8 38.9,23.68
  Bottom 0.635: R13.2 39.38,20.3 38.92,20.76 38.9,20.76 | D1.C 38.9,28.7 38.7,28.7 38.09,28.09 38.09,24.48 38.9,23.68
N$2
  Top 0.203: LK1.3 16.72,29.15 18.1,27.77 IC1.DIO0
N$3
  Bottom 0.635: FS1.1 60.24,38.32 60.24,37.34 POWER.P$2
N$4
  Top 0.203: IC1.DIO1 20.1,27.58 20.23,27.58 21.8,29.15 LK1.1
N$6
  Bottom 0.635: D1.A 43.87,29.87 54.38,29.87 56.58,32.07 56.58,34.8 57.3,35.52 FS1.2
N$7
  Bottom 0.203: Q1.B 9.04,9.49 8.53,10.01 4.16,10.01 3.17,10.99 3.17,11.52 R15.1
N$8
  Top 0.635: CONJ.2 8.98,29.32 9.34,29.32 11.1,27.56 11.1,24.68 11.91,23.87 11.91,22.62 11.11,21.82 11.11,12.44 8.37,9.71 7.64,9.71 Q1.C
N$10
  Bottom 0.406: 25.2,37.1 arc90 LK2.2 | LK2.2 21.04,37.12 20.45,37.12 20.07,37.5 COND.2 | LK2.2
NRESET  (via drill 0.3 pad 0.46)
  Top 0.203: 44.69,14.27 39.62,14.27 v31.23,22.67 | 44.69,14.27 47.78,17.36 49.18,17.36 56.37,24.55 56.37,31.35 IC2.21 | 44.69,14.27 44.69,9.22 45.68,8.23 45.8,8.23 45.95,8.08 45.95,5.41 46.69,4.67 CONB.4 | v14.67,16.64 12.1,14.07 IC1.RESET
  Bottom 0.203: v31.23,22.67 31.23,23.04 30.47,23.8 21.53,23.8 14.67,16.93 v14.67,16.64
NSS  (via drill 0.3 pad 0.46)
  Top 0.203: v6.81,7.72 7.39,7.15 10.74,7.15 | 10.74,7.15 14.1,10.51 IC1.NSS | v22.05,2.54 17.78,2.54 16.66,1.43 14.48,1.43 13.85,2.06 13.85,4.04 10.74,7.15
  Bottom 0.203: R7.1 6.21,8.32 v6.81,7.72 | v22.05,2.54 22.14,2.46 29.92,2.46 30.27,2.81 47.49,2.81 48.3,3.62 48.3,3.74 CONB.3 49.7,3.74 50.16,3.74 50.16,3.86 50.97,4.67 59.36,4.67 61.87,7.18 61.87,7.3 IC2.14
RST
  Top 0.203: CONL.2 62.2,2.72 61.98,2.5 RESET.P$4
  Bottom 0.203: IC2.RST 19.62,3.65 21.2,2.06 30.53,2.06 30.92,2.45 61.05,2.45 RESET.P$4
RX0
  Top 0.203: CONF.3 29.3,38.4 29.3,38.52 28.49,39.33 21.82,39.33 21.36,38.87 21.36,34.87 20.13,33.63 19.62,33.63 IC2.44
SCL  (via drill 0.3 pad 0.46)
  Top 0.203: CONE.3 30.23,34.93 31.05,34.11 v31.05,32.28 | CONI.3 72.51,22.2 72.39,22.2 71.31,22.2 70.91,22.6 70.91,27.41 69.89,28.43 66.16,28.43 63.73,30.86 63.73,33.51 63.23,34.01 59.8,34.01 57.13,36.69 CONH.1 55.8,36.69 55.35,36.69 55.35,36.47 54.15,35.27 CONG.4
  Bottom 0.203: 33.16,30.08 33.16,28.55 31.73,27.12 31.73,26.1 | 36.79,30.08 | 36.79,30.08 33.16,30.08 | 33.16,30.08 31.05,32.19 v31.05,32.28 | CONH.1 55.35,36.69 55.35,36.91 52.91,39.35 34.48,39.35 34.02,38.89 34.02,37.91 32.94,36.84 32,36.84 31.16,36 31.16,35.86 CONE.3 | 36.79,30.08 36.92,29.95 36.92,23.27 36.65,23 R5.1 | 36.79,30.08 37.89,31.18 39.9,31.18 41.29,29.79 41.29,29.01 42.11,28.19 42.7,28.19 IC3.4 | 31.73,26.1 31.73,12.67 29.65,10.6 R1.1 | 31.73,26.1 R2.1 | CONI.3 72.51,20.34 72.63,20.34 73.44,19.53 73.44,15.35 71.94,13.86 51.69,13.86 48.11,10.28 44.27,10.28 43.53,9.54 41.44,9.54 IC4.6
SCL1
  Bottom 0.203: IC2.5 24.7,8.23 24.75,8.28 24.75,10.6 R1.2
SDA  (via drill 0.3 pad 0.46)
  Top 0.203: 72.51,24.74 CONI.4 72.51,26.79 70.09,29.21 66.81,29.21 64.08,31.94 64.08,32.23 64.08,33.7 63.17,34.62 60.44,34.62 57.48,37.58 55.13,37.58 CONH.2 53.35,35.8 49.8,35.8 49.3,36.3 44.37,36.3 CONG.3 44.37,34.24 43.97,33.84 43.97,32.46 41.42,29.91 v40.16,29.91 | v33.41,18.33 33.07,18.67 v29.39,18.67 28.67,19.39 28.67,28.18 28.46,28.39 28.46,34.16 27.69,34.93 CONE.4
  Bottom 0.203: 36.65,19.9 37.41,20.66 37.41,30.14 38.09,30.82 39.72,30.82 40.16,30.38 v40.16,29.91 40.16,29.46 41.44,28.19 IC3.3 | 36.65,19.9 36.65,19.5 39.18,16.98 43.71,16.98 44.05,16.64 44.05,13.38 42.7,12.03 IC4.5 | 36.65,19.9 36.56,19.9 R6.1 34.55,19.9 34.55,19.47 v33.41,18.33 | v29.39,18.67 28.77,18.05 28.6,18.05 R3.1 R4.1
SDA1  (via drill 0.3 pad 0.46)
  Top 0.203: v23.9,14.14 23.9,12.43 22.1,10.63 22.1,8.29 22.16,8.23 IC2.4
  Bottom 0.203: R3.2 24.75,16.8 24.75,14.99 v23.9,14.14
SDCSIN  (via drill 0.3 pad 0.46)
  Top 0.203: v29.78,28.45 29.78,23.09 30.06,22.81 30.21,22.81 44.78,8.23 45.02,8.23 IC2.3
  Bottom 0.203: R8.1 29.65,29.2 29.65,28.58 v29.78,28.45 | IC2.3 44.09,7.3 44.09,7.42 43.28,8.23 36.14,8.23 35.03,9.35 34.66,9.35 33.85,10.15 33.85,10.6 R14.2
SDCSOUT  (via drill 0.3 pad 0.46)
  Top 0.203: SD2.CS 48.45,15.34 45.18,12.06 v45.18,9.44
  Bottom 0.203: R14.1 35.6,9.35 36.24,8.71 44.44,8.71 v45.18,9.44 | SD2.CS 49.3,16.19 54.09,16.19 55.85,17.95 SD1.CS
TOUCHCS  (via drill 0.3 pad 0.46)
  Top 0.203: v27.69,5.5 27.69,3.16 28.8,2.05 28.91,2.05 CONA.TCS
  Bottom 0.203: 27.69,6.34 v27.69,5.5 | 27.69,6.34 28.04,6.34 28.85,7.15 28.85,8.08 29,8.23 33.11,8.23 33.93,7.41 33.93,7.3 IC2.16 | 27.69,6.34 23.93,6.34 23.11,7.16 23.11,9.19 22.5,9.79 R16.1
TOUCHIRQ  (via drill 0.3 pad 0.46)
  Top 0.203: CONA.TIRQ 22.14,1.2 23,2.05 23.92,2.05 25.44,3.58 v25.44,4.7
  Bottom 0.203: IC2.15 31.39,7.3 31.39,7.18 30.58,6.37 29.26,6.37 27.59,4.7 v25.44,4.7
TX0  (via drill 0.3 pad 0.46)
  Top 0.203: IC2.43 17.08,33.63 18.81,35.36 v18.81,37.65
  Bottom 0.203: CONF.4 26.76,38.4 25.83,39.33 19.3,39.33 18.81,38.84 v18.81,37.65

### Text on the board
bPlace: LK1
tNames: CONG | POWER | 1 | CONH | D | F | - | C | E | + | CONJ | LK2 | 5V | LK1 | GND | ESP32S3 LoRa | Camera Board | 120426 | CONI | - | c | b | e | Q1 | B | K | L | A
bNames: - | FS1 | + | C1 | D1 | SD2 | R8 | R2 | C2 | 120426 | ANT | SX1262 | R9 | RFM9X | R5 | IC3 | or | C3 | SD1 | + | R6 | C5 | R13 | C4 | R3 | R12 | R4 | R11 | R15 | IC4 | R10 | R14 | R16 | R1 | R7
tDocu: HC05 | Open Log